# Altium project NanoD1.PrjPcb (part 1 of 2)
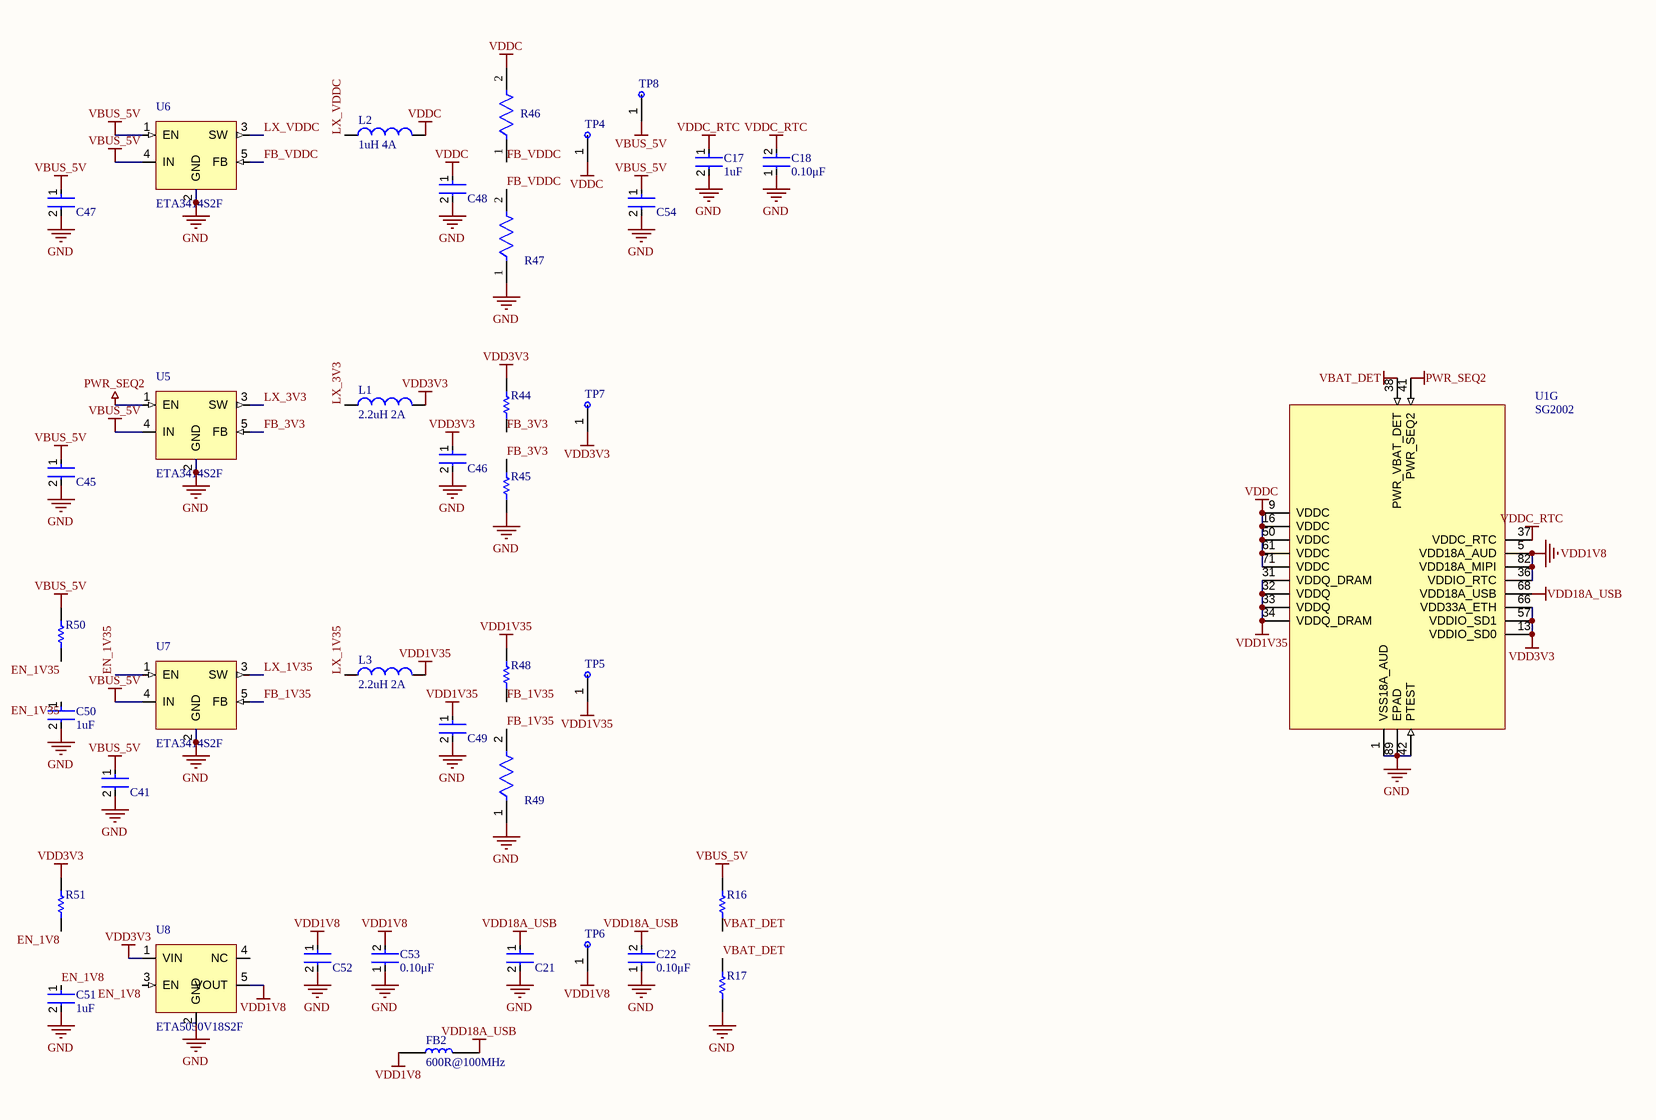
[diagram p0: NanoD1_Power.SchDoc]
8 sheets, 143 parts. Net scope: global (net labels, ports and power ports of the same name join across sheets).
Board file: NanoD1.PcbDoc
Sheets:
  NanoD1_Power.SchDoc
  NanoD1_Decoupling.SchDoc
  NanoD1_Storage.SchDoc
  NanoD1_USB.SchDoc
  NanoD1_Audio.SchDoc
  NanoD1_Wireless.SchDoc
  NanoD1_Clk_Reset.SchDoc
  NanoD1_IO.SchDoc

## Sheet NanoD1_Power.SchDoc
size 420 x 297 mm; ENG_APP_DATE: --/--/--; DSN_APP_DATE: --/--/--; CHK_APP_DATE: --/--/--; SheetNumber: 1; SheetTotal: 8

### Parts
C17  1uF  [FP-GRM15-0_1-IPC_B]
C18  value 0.10μF  [FP-GRM15-MFG]  (hidden comment: 100nF)
C21  10uF  [FP-GRM188-0_15-IPC_B]  (value not drawn)
C22  value 0.10μF  [FP-GRM15-MFG]  (hidden comment: 100nF)
C41  22uF  [FP-GRM21B-0_15-MFG]  (value not drawn)
C45  22uF  [FP-GRM21B-0_15-MFG]  (value not drawn)
C46  22uF  [FP-GRM188-0_2-IPC_C]  (value not drawn)
C47  22uF  [FP-GRM21B-0_15-MFG]  (value not drawn)
C48  22uF  [FP-GRM188-0_2-IPC_C]  (value not drawn)
C49  22uF  [FP-GRM188-0_2-IPC_C]  (value not drawn)
C50  1uF  [FP-GRM15-0_1-IPC_B]
C51  1uF  [FP-GRM15-0_1-IPC_B]
C52  4.7uF  [FP-GRM155-0_15-MFG]  (value not drawn)
C53  value 0.10μF  [FP-GRM15-MFG]  (hidden comment: 100nF)
C54  22uF  [FP-GRM21B-0_15-MFG]  (value not drawn)
FB2  600R@100MHz  [INDC1608X95N]
L1  2.2uH 2A  [FP-DFE252010C-MFG]
L2  value 1uH 4A  [FP-DFE252010C-MFG]  (hidden comment: 1.0uH 4A)
L3  2.2uH 2A  [FP-DFE252010C-MFG]
R16  30K 1%  [RESC1005X40X25ML05T10]  (value not drawn)
R17  10K 1%  [RESC1005X40X25ML05T10]  (value not drawn)
R44  100K 1%  [RESC1005X40X25ML05T10]  (value not drawn)
R45  22K6 1%  [RESC1005X40X25ML05T10]  (value not drawn)
R46  11K8 1%  [FP-RC0402-0_4-MFG]  (value not drawn)
R47  20K 1%  [FP-RC0402-0_4-MFG]  (value not drawn)
R48  15K 1%  [RESC1005X40X25ML05T10]  (value not drawn)
R49  12K 1%  [FP-RC0402-0_4-MFG]  (value not drawn)
R50  33K  [RESC1005X40X25ML05T10]  (value not drawn)
R51  33K  [RESC1005X40X25ML05T10]  (value not drawn)
TP4  TP  [TP-1.5mm]  (value not drawn)
TP5  TP  [TP-1.5mm]  (value not drawn)
TP6  TP  [TP-1.5mm]  (value not drawn)
TP7  TP  [TP-1.5mm]  (value not drawn)
TP8  TP  [TP-1.5mm]  (value not drawn)
U1  SG2002  [QFN88-9x9-0.35]  (part G of 7)
U5  ETA3414S2F  [SOT23-5]
U6  ETA3414S2F  [SOT23-5]
U7  ETA3414S2F  [SOT23-5]
U8  ETA5050V18S2F  [SOT23-5]

### Nets
GND: C17.2 C18.1 C21.2 C22.1 C41.2 C45.2 C46.2 C47.2 C48.2 C49.2 C50.2 C51.2 C52.2 C53.1 C54.2 R17.1 R45.1 R47.1 R49.1 U1.1(VSS18A_AUD) U1.42(PTEST) U1.89(EPAD) U5.2(GND) U6.2(GND) U7.2(GND) U8.2(GND)
PWR_SEQ2: U1.41(PWR_SEQ2) U5.1(EN)
VBAT_DET: R16.1 R17.2 U1.38(PWR_VBAT_DET)
VBUS_5V: C41.1 C45.1 C47.1 C54.1 R16.2 R50.2 TP8.1(TP) U5.4(IN) U6.1(EN) U6.4(IN) U7.4(IN)
VDD1V8: C52.1 C53.2 FB2.1 TP6.1(TP) U1.5(VDD18A_AUD) U1.36(VDDIO_RTC) U1.82(VDD18A_MIPI) U8.5(VOUT)
VDD1V35: C49.1 L3.2 R48.2 TP5.1(TP) U1.31(VDDQ_DRAM) U1.32(VDDQ) U1.33(VDDQ) U1.34(VDDQ_DRAM)
VDD3V3: C46.1 L1.2 R44.2 R51.2 TP7.1(TP) U1.13(VDDIO_SD0) U1.57(VDDIO_SD1) U1.66(VDD33A_ETH) U8.1(VIN)
VDD18A_USB: C21.1 C22.2 FB2.2 U1.68(VDD18A_USB)
VDDC: C48.1 L2.2 R46.2 TP4.1(TP) U1.9(VDDC) U1.16(VDDC) U1.50(VDDC) U1.61(VDDC) U1.71(VDDC)
VDDC_RTC: C17.1 C18.2 U1.37(VDDC_RTC)
EN_1V8: C51.1 R51.1 U8.3(EN)
EN_1V35: C50.1 R50.1 U7.1(EN)
FB_1V35: R48.1 R49.2 U7.5(FB)
FB_3V3: R44.1 R45.2 U5.5(FB)
FB_VDDC: R46.1 R47.2 U6.5(FB)
LX_1V35: L3.1 U7.3(SW)
LX_3V3: L1.1 U5.3(SW)
LX_VDDC: L2.1 U6.3(SW)

Not connected (* = marked no-connect by the designer): U8 4(NC)

### Notes on the sheet
- THIS DOCUMENT AND THE DATA DISCLOSED HEREIN OR
- HEREWITH IS THE PROPERTY OF ALTIUM LIMITED AND MAY
- DWG NO:
- REVISION
- REV:
- DESCRIPTION
- DATE
- APPROVED
- BE FREELY DISTRIBUTED IN WHOLE. NO RIGHTS ARE
- RESERVED OR EXPRESS OR IMPLIED WARANTEE GIVEN.
- ENG:
- APPROVALS
- PROJECT
- DSN:
- CHK:
- REFERENCE DOCUMENTS
- PROJECT REVISION:
- TITLE
- DOCUMENT REVISION:
- DESIGN ITEM:
- BOM:
- FAB DWG:
- PCB DWG:
- ASSY DWG:
- SCALE:
- A3
- SIZE
- CAGE CODE
- FILE NAME
- DWG NO.
- SHEET
- OF
- REV

### Library data of the parts
C17 C50 C51 = CMP-2008-04556-2: CAP CER 1UF 10V X5R 0402; Manufacturer Part Number: GRM155R61A105KE15D; Manufacturer: Murata; Material: Ceramic; Tolerance: 10%; Temperature Coefficient: 15%; Value: 1uF; Octopart: https://octopart.com/grm155r61a105ke15d-murata-197442; Lead Free: Yes; ComponentLink2Description: Datasheet; Temperature: -55°C to +85°C; Temperature Range High: +85°C; Height: 0.55mm; Capacitance: 1uF; Ipc Land Pattern Name: CAPC10050X50; ComponentLink2URL: https://search.murata.co.jp/Ceramy/image/img/A01X/G101/ENG/GRM155R61A105KE15-01A.pdf; Temperature Range Low: -55°C; Device Class L2: Capacitors; Voltage Rating: 10V; RoHS: TRUE; Device Class L1: Passive Components; Device Class L3: Ceramic Capacitors; Temperature Characteristic: X5R; Mouser Description: 0402 1 uF 10 V ±10% Tolerance X5R Surface Mount Multilayer Ceramic Capacitor; Automotive: No; Package: GRM15-0.1; Digikey Description: CAP CER 1UF 10V X5R 0402; Category: Cap
C18 C22 C53 = CMP-2100-03641-2: CAP CER 0.1UF 16V X7R 0402; Manufacturer Part Number: GRM155R71C104KA88D; Manufacturer: Murata; Standoff Height: 0mm; Tolerance: 10%; Voltage Rating: 16Vdc; Material: Ceramic; RoHS: TRUE; Temperature Characteristic: X7R; Octopart: https://octopart.com/grm155r71c104ka88d-murata-196880; Digikey Description: CAP CER 0.1UF 16V X7R 0402; Device Class L3: Ceramic Capacitors; Height: 0.55mm; ComponentLink2Description: Datasheet; Temperature Range Low: -55°C; Ipc Land Pattern Name: CAPC10050X219; ComponentLink2URL: https://search.murata.co.jp/Ceramy/image/img/A01X/G101/ENG/GRM155R71H471KA01-01A.pdf; Device Class L1: Passive Components; Lead Free: yes; Category: Cap; Package: GRM15; Temperature: -55°C to +125°C; Device Class L2: Capacitors; Capacitance: 0.10μF; Temperature Range High: +125°C; Mouser Description: 0402 0.1 uF 16V ±10 % Tolerance X7R SMT Multilayer Ceramic Capacitor
C21 = CMP-06035-003612-1: Chip Multilayer Ceramic Capacitors for General Purpose, 0603, 10uF, X5R, 15%, 20%, 10V; Tolerance: 20%; Dielectric: X5R; Package Quantity: 4000; Width: 0.8mm; Case/Package: 0603; Thickness: 0.035inch; Capacitance: 10uF; Voltage Rating: 10V; Voltage Rating (DC): 10V; Termination: SMD/SMT; Length: 1.6mm; Lead Free: Lead Free; Mount: Surface Mount; Height: 0.8mm; Depth: 0.8mm; Packaging: Tape and Reel; Weight: 0.000222oz; Min Operating Temperature: -55°C; Case Code (Metric): 1608; Max Operating Temperature: 85°C; Case Code (Imperial): 0603; Material: Ceramic
C41 C45 C47 C54 = CMP-2000-06340-2: Chip Multilayer Ceramic Capacitors for General Purpose, 0805, 22uF, X5R, 15%, 20%, 10V; Thickness: 0.055inch; Length: 2mm; Tolerance: 20%; Max Operating Temperature: 85°C; REACH SVHC: No SVHC; Capacitance: 22uF; Voltage Rating: 10V; Weight: 0.000335oz; Case Code (Metric): 2012; Case Code (Imperial): 0805; Height: 1.25mm; Min Operating Temperature: -55°C; Voltage Rating (DC): 10V; Lead Free: Lead Free; Package Quantity: 3000; Case/Package: 0805; Dielectric: X5R; Mount: Surface Mount; Termination: SMD/SMT; Width: 0.049inch; Depth: 1.25mm; Packaging: Tape and Reel; Radiation Hardening: No
C46 C48 C49 = CMP-2000-06337-3: Chip Multilayer Ceramic Capacitors for General Purpose, 0603, 22uF, X5R, 15%, 20%, 10V; Thickness: 0.039inch; Length: 1.6mm; Tolerance: 20%; Max Operating Temperature: 85°C; REACH SVHC: No SVHC; Capacitance: 22uF; Voltage Rating: 10V; Weight: 0.000222oz; Case Code (Metric): 1608; Case Code (Imperial): 0603; Height: 0.8mm; Min Operating Temperature: -55°C; Voltage Rating (DC): 10V; Lead Free: Lead Free; Package Quantity: 4000; Case/Package: 0603; Dielectric: X5R; Mount: Surface Mount; Termination: SMD/SMT; Width: 0.8mm; Depth: 0.8mm; Packaging: Tape and Reel; Material: Ceramic
C52 = CMP-06035-003573-1: Chip Multilayer Ceramic Capacitors for General Purpose, 0402, 4.7uF, X5R, 15%, 20%, 10V; Case/Package: 0402; Voltage Rating: 10V; Min Operating Temperature: -55°C; Mount: Surface Mount; Packaging: Tape and Reel; Max Operating Temperature: 85°C; Capacitance: 4.7uF; Case Code (Metric): 1005; Case Code (Imperial): 0402; Tolerance: 20%
FB2 = MPZ1608S601ATA00: 600 Ohms @ 100 MHz 1 Power Line Ferrite Bead 0603 (1608 Metric) 1A 150mOhm; MF: TDK; SnapEDA_Link: https://www.snapeda.com/parts/MPZ1608S601ATA00/TDK/view-part/?ref=snap; Package: 0603 TDK; Value: 600R@100MHz; MP: MPZ1608S601ATA00; Check_prices: https://www.snapeda.com/parts/MPZ1608S601ATA00/TDK/view-part/?ref=eda
L1-L3 = Inductor: Code_IEC: 1005; Published: 8-Jun-2000; LatestRevisionDate: 29-May-2009; LatestRevisionNote: IPC-7351 Footprint Added.; PackageReference: 0402-A; Publisher: Altium Limited; PackageDescription: Chip Inductor; Code_JEITA: 0402
  L1 L3: Value: 2.2uH 2A
R16 = CMP-2002-07602-1: Manufacturer: Yageo / Phycomp; Part Number: RC0402FR-0730KL
R17 = CMP-2002-07353-1: Part Number: RC0402FR-0710KL; Manufacturer: Yageo / Phycomp
R44 = CMP-2002-07343-1: Part Number: RC0402FR-07100KL; Manufacturer: Yageo / Phycomp
R45 = CMP-2002-07516-1: Part Number: RC0402FR-0722K6L; Manufacturer: Yageo
R46 = CMP-2002-07909-2: NexarPartId: 9293467; Resistance: 11.8kΩ; Voltage Rating (DC): 50V; Temperature Coefficient: 100ppm/°C; Max Power Dissipation: 63mW; Depth: 500µm; Features: Moisture Resistant; Tolerance: 1%; Case Code (Metric): 1005; Number of Terminations: 2; Width: 508µm; Length: 1mm; Case Code (Imperial): 0402; Max Operating Temperature: 155°C; Composition: Thick Film; Case/Package: 0402; Contact Plating: Lead, Tin; Weight: 652.039032µg; Voltage Rating: 50V; Military Standard: Not; Radiation Hardening: No; Termination: SMD/SMT; RoHS: Compliant; Height: 400µm; Lead Free: Lead Free; Packaging: Tape & Reel; Min Operating Temperature: -55°C; Schedule B: 8533210045, 8533210045|8533210045, 8533210045|8533210045|8533210045, 8533210045|8533210045|8533210045|8533210045; Power Rating: 63mW
R47 = CMP-2002-07501-2: NexarPartId: 39794396; Resistance: 20kΩ; Max Power Dissipation: 63mW; Voltage Rating: 50V; Temperature Coefficient: 100ppm/°C; Power Rating: 62.5mW; Termination: SMD/SMT; Features: Moisture Resistant; Max Operating Temperature: 155°C; Number of Pins: 2; Length: 1mm; Min Operating Temperature: -55°C; RoHS: Compliant; Width: 500µm; Composition: Thick Film; Case/Package: 0402; Depth: 500µm; Lead Free: Lead Free; Height: 350µm; Packaging: Tape & Reel; Military Standard: Not; Tolerance: 1%; Case Code (Imperial): 0402; Case Code (Metric): 1005; Schedule B: 8533210045, 8533210045|8533210045|8533210045|8533210045|8533210045|8533210045|8533210045|8533210045|8533210045|8533210045|8533210045|8533210045|8533210045|8533210045|8533210045|8533210045|8533210045|8533210045|8533210045|8533210045|8533210045|8533210045|8533210045|85; Number of Terminations: 2; Voltage Rating (DC): 50V; REACH SVHC: No SVHC
R48 = CMP-2002-07410-1: Manufacturer: Yageo / Phycomp; Part Number: RC0402FR0715KL
R49 = CMP-2002-07378-2: RES SMD 12K OHM 1% 1/16W 0402; Power Rating: 62.5mW; Voltage Rating: 50V; Resistance: 12kR; Max Power Dissipation: 63mW; Temperature Coefficient: 100ppm/°C; Construction: Rectangular; Case Code (Metric): 1005; Package Quantity: 1; Weight: 2.3E-05oz; RoHS Compliant: Yes; Packaging: Tape and Reel; Case Code (Imperial): 0402; Military Standard: Not; Min Operating Temperature: -55°C; Depth: 0.5mm; Length: 1mm; Width: 0.02inch; Termination: SMD/SMT; Lead Free: Lead Free; Tolerance: 1%; REACH SVHC: No SVHC; Size Code: 0402; Resistance Tolerance: 1%; Series: RC; Max Operating Temperature: 155°C; Height: 0.016inch; Features: Moisture Resistant; Number of Terminations: 2; Case/Package: 0402; Resistor Type: Thick Film
R50 R51 = CMP-2002-07617-1: Part Number: RC0402FR-0733KL; Manufacturer: Yageo / Phycomp
TP4-TP8 = TestPoint: Test point, 1.5 mm exposed pad
U1 = SG2002: RISC-V C906 / Cortex-A53 SoC, 256MB DDR3 SiP, QFN88 9x9 0.35mm
U5-U7 = ETA3414: 1.5A 3MHz synchronous step-down converter, SOT23-5
U8 = ETA5050V18: 1.8V fixed LDO, SOT23-5

## Sheet NanoD1_Decoupling.SchDoc
size 420 x 297 mm; SheetNumber: 2; SheetTotal: 8
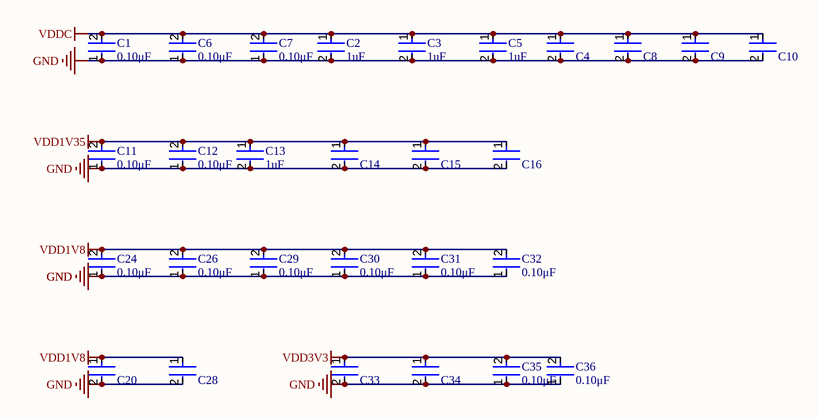
[diagram p1: NanoD1_Decoupling.SchDoc]

### Parts
C1  value 0.10μF  [FP-GRM15-MFG]  (hidden comment: 100nF)
C2  1uF  [FP-GRM15-0_1-IPC_B]
C3  1uF  [FP-GRM15-0_1-IPC_B]
C4  4.7uF  [FP-GRM155-0_15-MFG]  (value not drawn)
C5  1uF  [FP-GRM15-0_1-IPC_B]
C6  value 0.10μF  [FP-GRM15-MFG]  (hidden comment: 100nF)
C7  value 0.10μF  [FP-GRM15-MFG]  (hidden comment: 100nF)
C8  4.7uF  [FP-GRM155-0_15-MFG]  (value not drawn)
C9  10uF  [FP-GRM188-0_15-IPC_B]  (value not drawn)
C10  10uF  [FP-GRM188-0_15-IPC_B]  (value not drawn)
C11  value 0.10μF  [FP-GRM15-MFG]  (hidden comment: 100nF)
C12  value 0.10μF  [FP-GRM15-MFG]  (hidden comment: 100nF)
C13  1uF  [FP-GRM15-0_1-IPC_B]
C14  4.7uF  [FP-GRM155-0_15-MFG]  (value not drawn)
C15  4.7uF  [FP-GRM155-0_15-MFG]  (value not drawn)
C16  10uF  [FP-GRM188-0_15-IPC_B]  (value not drawn)
C20  10uF  [FP-GRM188-0_15-IPC_B]  (value not drawn)
C24  value 0.10μF  [FP-GRM15-MFG]  (hidden comment: 100nF)
C26  value 0.10μF  [FP-GRM15-MFG]  (hidden comment: 100nF)
C28  10uF  [FP-GRM188-0_15-IPC_B]  (value not drawn)
C29  value 0.10μF  [FP-GRM15-MFG]  (hidden comment: 100nF)
C30  value 0.10μF  [FP-GRM15-MFG]  (hidden comment: 100nF)
C31  value 0.10μF  [FP-GRM15-MFG]  (hidden comment: 100nF)
C32  value 0.10μF  [FP-GRM15-MFG]  (hidden comment: 100nF)
C33  10uF  [FP-GRM188-0_15-IPC_B]  (value not drawn)
C34  10uF  [FP-GRM188-0_15-IPC_B]  (value not drawn)
C35  value 0.10μF  [FP-GRM15-MFG]  (hidden comment: 100nF)
C36  value 0.10μF  [FP-GRM15-MFG]  (hidden comment: 100nF)

### Nets
GND: C1.1 C2.2 C3.2 C4.2 C5.2 C6.1 C7.1 C8.2 C9.2 C10.2 C11.1 C12.1 C13.2 C14.2 C15.2 C16.2 C20.2 C24.1 C26.1 C28.2 C29.1 C30.1 C31.1 C32.1 C33.2 C34.2 C35.1 C36.1
VDD1V8: C20.1 C24.2 C26.2 C28.1 C29.2 C30.2 C31.2 C32.2
VDD1V35: C11.2 C12.2 C13.1 C14.1 C15.1 C16.1
VDD3V3: C33.1 C34.1 C35.2 C36.2
VDDC: C1.2 C2.1 C3.1 C4.1 C5.1 C6.2 C7.2 C8.1 C9.1 C10.1

### Notes on the sheet
- THIS DOCUMENT AND THE DATA DISCLOSED HEREIN OR
- HEREWITH IS THE PROPERTY OF ALTIUM LIMITED AND MAY
- DWG NO:
- REVISION
- REV:
- DESCRIPTION
- DATE
- APPROVED
- BE FREELY DISTRIBUTED IN WHOLE. NO RIGHTS ARE
- RESERVED OR EXPRESS OR IMPLIED WARANTEE GIVEN.
- ENG:
- APPROVALS
- PROJECT
- DSN:
- CHK:
- REFERENCE DOCUMENTS
- PROJECT REVISION:
- TITLE
- DOCUMENT REVISION:
- DESIGN ITEM:
- BOM:
- FAB DWG:
- PCB DWG:
- ASSY DWG:
- SCALE:
- A3
- SIZE
- CAGE CODE
- FILE NAME
- DWG NO.
- SHEET
- OF
- REV

### Library data of the parts
C1 C6 C7 C11 C12 C24 C26 C29-C32 C35 C36 = CMP-2100-03641-2: as C18 on sheet NanoD1_Power; RoHS: TRUE; Temperature Characteristic: X7R; Octopart: https://octopart.com/grm155r71c104ka88d-murata-196880; Digikey Description: CAP CER 0.1UF 16V X7R 0402; Device Class L3: Ceramic Capacitors; Height: 0.55mm; ComponentLink2Description: Datasheet; Temperature Range Low: -55°C; Ipc Land Pattern Name: CAPC10050X219; ComponentLink2URL: https://search.murata.co.jp/Ceramy/image/img/A01X/G101/ENG/GRM155R71H471KA01-01A.pdf; Device Class L1: Passive Components; Lead Free: yes; Category: Cap; Package: GRM15; Temperature: -55°C to +125°C; Device Class L2: Capacitors; Capacitance: 0.10μF; Temperature Range High: +125°C; Mouser Description: 0402 0.1 uF 16V ±10 % Tolerance X7R SMT Multilayer Ceramic Capacitor
C2 C3 C5 C13 = CMP-2008-04556-2: as C17 on sheet NanoD1_Power; Value: 1uF; Octopart: https://octopart.com/grm155r61a105ke15d-murata-197442; Lead Free: Yes; ComponentLink2Description: Datasheet; Temperature: -55°C to +85°C; Temperature Range High: +85°C; Height: 0.55mm; Capacitance: 1uF; Ipc Land Pattern Name: CAPC10050X50; ComponentLink2URL: https://search.murata.co.jp/Ceramy/image/img/A01X/G101/ENG/GRM155R61A105KE15-01A.pdf; Temperature Range Low: -55°C; Device Class L2: Capacitors; Voltage Rating: 10V; RoHS: TRUE; Device Class L1: Passive Components; Device Class L3: Ceramic Capacitors; Temperature Characteristic: X5R; Mouser Description: 0402 1 uF 10 V ±10% Tolerance X5R Surface Mount Multilayer Ceramic Capacitor; Automotive: No; Package: GRM15-0.1; Digikey Description: CAP CER 1UF 10V X5R 0402; Category: Cap
C4 C8 C14 C15 = CMP-06035-003573-1: as C52 on sheet NanoD1_Power; Case/Package: 0402; Voltage Rating: 10V; Min Operating Temperature: -55°C; Mount: Surface Mount; Packaging: Tape and Reel; Max Operating Temperature: 85°C; Capacitance: 4.7uF; Case Code (Metric): 1005; Case Code (Imperial): 0402; Tolerance: 20%
C9 C10 C16 C20 C28 C33 C34 = CMP-06035-003612-1: as C21 on sheet NanoD1_Power; Tolerance: 20%; Dielectric: X5R; Package Quantity: 4000; Width: 0.8mm; Case/Package: 0603; Thickness: 0.035inch; Capacitance: 10uF; Voltage Rating: 10V; Voltage Rating (DC): 10V; Termination: SMD/SMT; Length: 1.6mm; Lead Free: Lead Free; Mount: Surface Mount; Height: 0.8mm; Depth: 0.8mm; Packaging: Tape and Reel; Weight: 0.000222oz; Min Operating Temperature: -55°C; Case Code (Metric): 1608; Max Operating Temperature: 85°C; Case Code (Imperial): 0603; Material: Ceramic

## Sheet NanoD1_Storage.SchDoc
size 420 x 297 mm; SheetNumber: 3; SheetTotal: 8
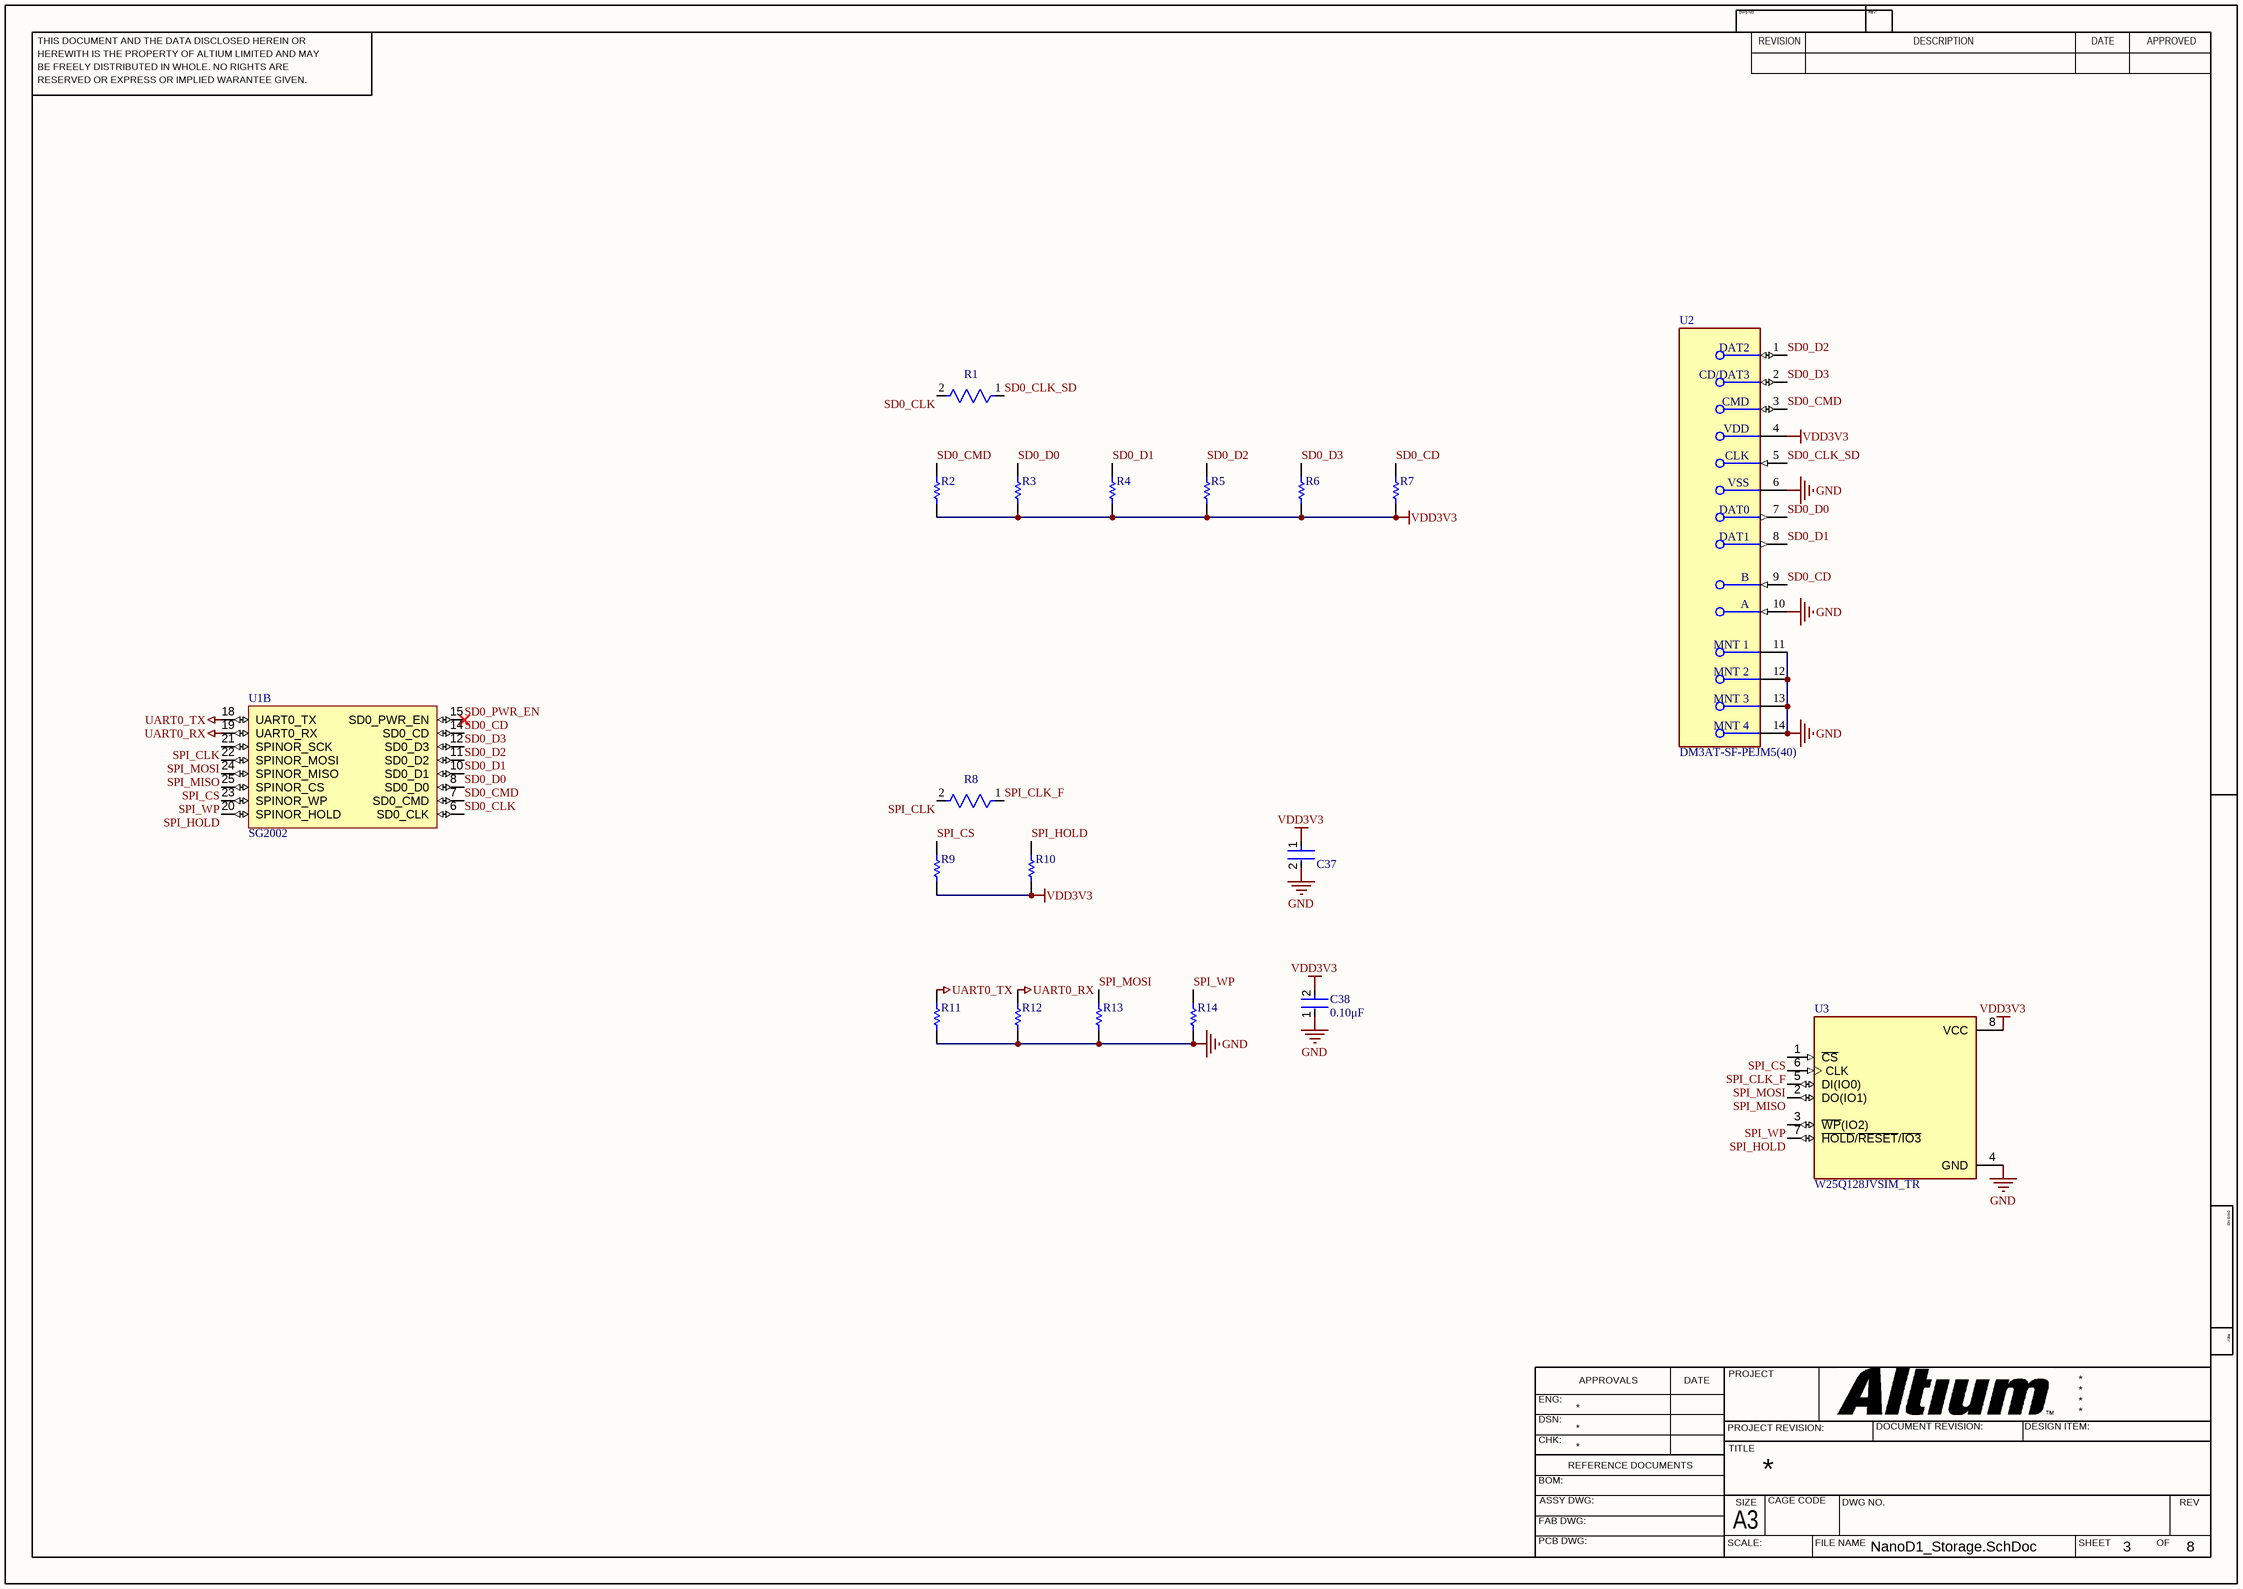
[diagram p2: NanoD1_Storage.SchDoc]

### Parts
C37  10uF  [FP-GRM188-0_15-IPC_B]  (value not drawn)
C38  value 0.10μF  [FP-GRM15-MFG]  (hidden comment: 100nF)
R1  22R  [FP-RC0402-0_4-IPC_A]  (value not drawn)
R2  10K  [RESC1005X40X25ML05T10]  (value not drawn)
R3  10K  [RESC1005X40X25ML05T10]  (value not drawn)
R4  10K  [RESC1005X40X25ML05T10]  (value not drawn)
R5  10K  [RESC1005X40X25ML05T10]  (value not drawn)
R6  10K  [RESC1005X40X25ML05T10]  (value not drawn)
R7  10K 1%  [RESC1005X40X25ML05T10]  (value not drawn)
R8  22R  [FP-RC0402-0_4-IPC_A]  (value not drawn)
R9  4.7K  [RESC1005X40X25ML05T10]  (value not drawn)
R10  4.7K  [RESC1005X40X25ML05T10]  (value not drawn)
R11  4.7K  [RESC1005X40X25ML05T10]  (value not drawn)
R12  4.7K  [RESC1005X40X25ML05T10]  (value not drawn)
R13  4.7K  [RESC1005X40X25ML05T10]  (value not drawn)
R14  4.7K  [RESC1005X40X25ML05T10]  (value not drawn)
U1  SG2002  [QFN88-9x9-0.35]  (part B of 7)
U2  DM3AT-SF-PEJM5(40)  [FP-DM3AT-SF-PEJM5_40-MFG]
U3  W25Q128JVSIM_TR  [SOIC127P790X216-8N]

### Nets
GND: C37.2 C38.1 R11.1 R12.1 R13.1 R14.1 U2.6(VSS) U2.10(A) U2.11(MNT_1) U2.12(MNT_2) U2.13(MNT_3) U2.14(MNT_4) U3.4(GND)
UART0_RX: R12.2 U1.19(UART0_RX)
UART0_TX: R11.2 U1.18(UART0_TX)
VDD3V3: C37.1 C38.2 R2.1 R3.1 R4.1 R5.1 R6.1 R7.1 R9.1 R10.1 U2.4(VDD) U3.8(VCC)
SD0_CD: R7.2 U1.14(SD0_CD) U2.9(B)
SD0_CLK: R1.2 U1.6(SD0_CLK)
SD0_CLK_SD: R1.1 U2.5(CLK)
SD0_CMD: R2.2 U1.7(SD0_CMD) U2.3(CMD)
SD0_D0: R3.2 U1.8(SD0_D0) U2.7(DAT0)
SD0_D1: R4.2 U1.10(SD0_D1) U2.8(DAT1)
SD0_D2: R5.2 U1.11(SD0_D2) U2.1(DAT2)
SD0_D3: R6.2 U1.12(SD0_D3) U2.2(CD/DAT3)
SD0_PWR_EN: U1.15(SD0_PWR_EN)
SPI_CLK: R8.2 U1.21(SPINOR_SCK)
SPI_CLK_F: R8.1 U3.6(CLK)
SPI_CS: R9.2 U1.25(SPINOR_CS) U3.1(~{CS})
SPI_HOLD: R10.2 U1.20(SPINOR_HOLD) U3.7(~{HOLD}/~{RESET}/~{IO3})
SPI_MISO: U1.24(SPINOR_MISO) U3.2(DO(IO1))
SPI_MOSI: R13.2 U1.22(SPINOR_MOSI) U3.5(DI(IO0))
SPI_WP: R14.2 U1.23(SPINOR_WP) U3.3(~{WP}(IO2))

### Notes on the sheet
- THIS DOCUMENT AND THE DATA DISCLOSED HEREIN OR
- HEREWITH IS THE PROPERTY OF ALTIUM LIMITED AND MAY
- DWG NO:
- REVISION
- REV:
- DESCRIPTION
- DATE
- APPROVED
- BE FREELY DISTRIBUTED IN WHOLE. NO RIGHTS ARE
- RESERVED OR EXPRESS OR IMPLIED WARANTEE GIVEN.
- ENG:
- APPROVALS
- PROJECT
- DSN:
- CHK:
- REFERENCE DOCUMENTS
- PROJECT REVISION:
- TITLE
- DOCUMENT REVISION:
- DESIGN ITEM:
- BOM:
- FAB DWG:
- PCB DWG:
- ASSY DWG:
- SCALE:
- A3
- SIZE
- CAGE CODE
- FILE NAME
- DWG NO.
- SHEET
- OF
- REV

### Library data of the parts
C37 = CMP-06035-003612-1: as C21 on sheet NanoD1_Power; Tolerance: 20%; Dielectric: X5R; Package Quantity: 4000; Width: 0.8mm; Case/Package: 0603; Thickness: 0.035inch; Capacitance: 10uF; Voltage Rating: 10V; Voltage Rating (DC): 10V; Termination: SMD/SMT; Length: 1.6mm; Lead Free: Lead Free; Mount: Surface Mount; Height: 0.8mm; Depth: 0.8mm; Packaging: Tape and Reel; Weight: 0.000222oz; Min Operating Temperature: -55°C; Case Code (Metric): 1608; Max Operating Temperature: 85°C; Case Code (Imperial): 0603; Material: Ceramic
C38 = CMP-2100-03641-2: as C18 on sheet NanoD1_Power; RoHS: TRUE; Temperature Characteristic: X7R; Octopart: https://octopart.com/grm155r71c104ka88d-murata-196880; Digikey Description: CAP CER 0.1UF 16V X7R 0402; Device Class L3: Ceramic Capacitors; Height: 0.55mm; ComponentLink2Description: Datasheet; Temperature Range Low: -55°C; Ipc Land Pattern Name: CAPC10050X219; ComponentLink2URL: https://search.murata.co.jp/Ceramy/image/img/A01X/G101/ENG/GRM155R71H471KA01-01A.pdf; Device Class L1: Passive Components; Lead Free: yes; Category: Cap; Package: GRM15; Temperature: -55°C to +125°C; Device Class L2: Capacitors; Capacitance: 0.10μF; Temperature Range High: +125°C; Mouser Description: 0402 0.1 uF 16V ±10 % Tolerance X7R SMT Multilayer Ceramic Capacitor
R1 R8 = CMP-2002-07520-2: Tolerance: 1%; Power Rating: 63mW; Voltage Rating: 50V; Temperature Coefficient: 100ppm/°C; Resistance: 22Ω; Termination: SMD/SMT; Depth: 500µm; Packaging: Tape & Reel; Height: 400µm; Width: 500µm; Case Code (Imperial): 0402; Length: 1mm; Schedule B: 8533210045, 8533210045|8533210045|8533210045|8533210045|8533210045|8533210045|8533210045|8533210045, 8533210045|8533210045|8533210045|8533210045|8533210045|8533210045|8533210045|8533210045|8533210045, 8533210045|8533210045|8533210045|8533210045|8533210045|8533210045|8533210045|8533210045|8533210045|8533210045; Case/Package: 0402; Max Operating Temperature: 155°C; Min Operating Temperature: -55°C; REACH SVHC: Unknown; RoHS: Compliant; Military Standard: Not; Voltage Rating (DC): 50V; Lead Free: Lead Free; Voltage Rating (AC): 50V; Number of Pins: 2; Composition: Thick Film
R2-R7 = CMP-2002-07353-1: as R17 on sheet NanoD1_Power
R9-R14 = CMP-1011-00586-2: Manufacturer: Yageo / Phycomp; Part Number: RC0402FR-074K7L
U1 = SG2002: as U1 on sheet NanoD1_Power
U2 = CMP-11597-000006-1: CONN MICRO SD R/A PUSH-PUSH SMD; Contact Resistance: 100mR; Insulation Resistance: 1GR; Gender: Receptacle; Max Voltage Rating (AC): 125V; Pitch: 1.1mm; Mating Cycles: 10000; Max Current Rating: 500mA; Connector Type: Connector; Number of Contacts: 8; Housing Material: Polymer; Flammability Rating: UL94 V-0; REACH SVHC: No SVHC; Lead Free: Lead Free; Package Quantity: 400; Length: 13.85mm; Number of Rows: 2; Series: DM3; Min Operating Temperature: -25°C; Voltage Rating (AC): 125V; Contact Material: Copper Alloy; Depth: 15.95mm; Contact Plating: Gold; Packaging: Tape and Reel; Width: 13.85mm; Orientation: Right Angle; Color: Black; Voltage Rating: 125V; Radiation Hardening: No; Termination: Solder; Current Rating: 500mA; Mount: Surface Mount; Max Operating Temperature: 85°C
U3 = W25Q128JVSIM_TR: FLASH - NOR Memory IC 128Mb (16M x 8) SPI - Quad I/O, QPI, DTR 133 MHz 8-SOIC; MF: Winbond Electronics; MP: W25Q128JVSIM TR; SnapEDA_Link: https://www.snapeda.com/parts/W25Q128JVSIM%20TR/Winbond/view-part/?ref=snap; Package: SOIC-8 Winbond Electronics; Value: *; Check_prices: https://www.snapeda.com/parts/W25Q128JVSIM%20TR/Winbond/view-part/?ref=eda

## Sheet NanoD1_USB.SchDoc
size 420 x 297 mm; SheetNumber: 4; SheetTotal: 8
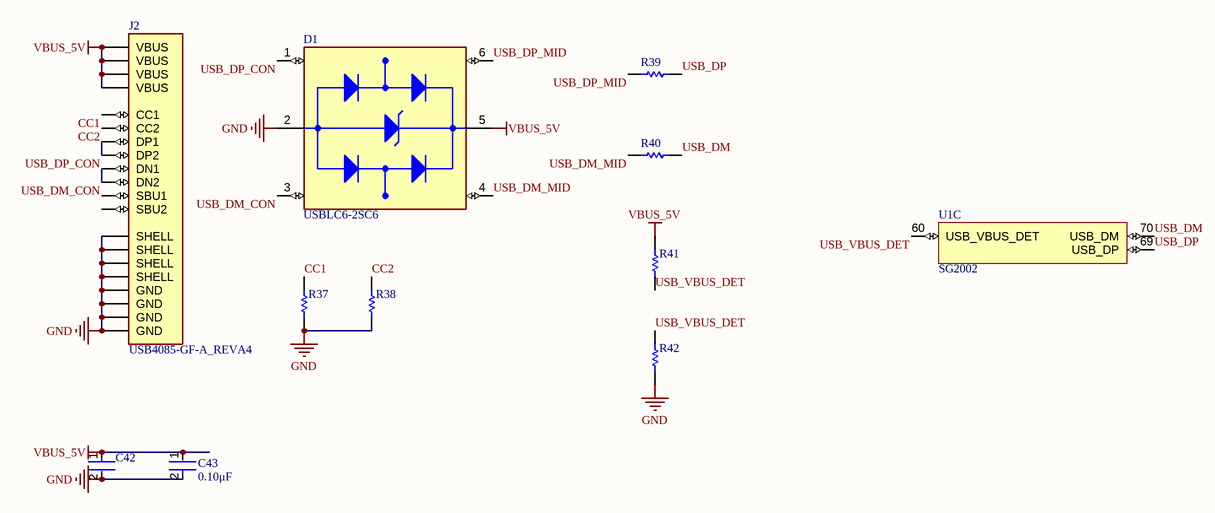
[diagram p3: NanoD1_USB.SchDoc]

### Parts
C42  10uF  [FP-GRM188-0_15-IPC_B]  (value not drawn)
C43  value 0.10μF  [FP-GRM15-MFG]  (hidden comment: 100nF)
D1  USBLC6-2SC6  [SOT95P280X145-6N]
J2  USB4085-GF-A_REVA4  [GCT_USB4085-GF-A_REVA4]
R37  5K1  [RESC1005X40X25ML05T10]  (value not drawn)
R38  5K1  [RESC1005X40X25ML05T10]  (value not drawn)
R39  5R1  [RESC1005X40X25ML05T10]  (value not drawn)
R40  5R1  [RESC1005X40X25ML05T10]  (value not drawn)
R41  100K  [RESC1005X40X25ML05T10]  (value not drawn)
R42  47K  [RESC1005X40X25ML05T10]  (value not drawn)
U1  SG2002  [QFN88-9x9-0.35]  (part C of 7)

### Nets
GND: C42.2 C43.2 D1.2(GND) J2.A1(GND) J2.A12(GND) J2.B1(GND) J2.B12(GND) J2.S1(SHELL) J2.S2(SHELL) J2.S3(SHELL) J2.S4(SHELL) R37.1 R38.1 R42.1
VBUS_5V: C42.1 C43.1 D1.5(VBUS) J2.A4(VBUS) J2.A9(VBUS) J2.B4(VBUS) J2.B9(VBUS) R41.2
CC1: J2.A5(CC1) R37.2
CC2: J2.B5(CC2) R38.2
USB_DM: R40.1 U1.70(USB_DM)
USB_DM_CON: D1.3(I/O2_IN) J2.A7(DN1) J2.B7(DN2)
USB_DM_MID: D1.4(I/O2_OUT) R40.2
USB_DP: R39.1 U1.69(USB_DP)
USB_DP_CON: D1.1(I/O1_IN) J2.A6(DP1) J2.B6(DP2)
USB_DP_MID: D1.6(I/O1_OUT) R39.2
USB_VBUS_DET: R41.1 R42.2 U1.60(USB_VBUS_DET)

Not connected (* = marked no-connect by the designer): J2 A8(SBU1) B8(SBU2)

### Notes on the sheet
- THIS DOCUMENT AND THE DATA DISCLOSED HEREIN OR
- HEREWITH IS THE PROPERTY OF ALTIUM LIMITED AND MAY
- DWG NO:
- REVISION
- REV:
- DESCRIPTION
- DATE
- APPROVED
- BE FREELY DISTRIBUTED IN WHOLE. NO RIGHTS ARE
- RESERVED OR EXPRESS OR IMPLIED WARANTEE GIVEN.
- ENG:
- APPROVALS
- PROJECT
- DSN:
- CHK:
- REFERENCE DOCUMENTS
- PROJECT REVISION:
- TITLE
- DOCUMENT REVISION:
- DESIGN ITEM:
- BOM:
- FAB DWG:
- PCB DWG:
- ASSY DWG:
- SCALE:
- A3
- SIZE
- CAGE CODE
- FILE NAME
- DWG NO.
- SHEET
- OF
- REV

### Library data of the parts
C42 = CMP-06035-003612-1: as C21 on sheet NanoD1_Power; Tolerance: 20%; Dielectric: X5R; Package Quantity: 4000; Width: 0.8mm; Case/Package: 0603; Thickness: 0.035inch; Capacitance: 10uF; Voltage Rating: 10V; Voltage Rating (DC): 10V; Termination: SMD/SMT; Length: 1.6mm; Lead Free: Lead Free; Mount: Surface Mount; Height: 0.8mm; Depth: 0.8mm; Packaging: Tape and Reel; Weight: 0.000222oz; Min Operating Temperature: -55°C; Case Code (Metric): 1608; Max Operating Temperature: 85°C; Case Code (Imperial): 0603; Material: Ceramic
C43 = CMP-2100-03641-2: as C18 on sheet NanoD1_Power; RoHS: TRUE; Temperature Characteristic: X7R; Octopart: https://octopart.com/grm155r71c104ka88d-murata-196880; Digikey Description: CAP CER 0.1UF 16V X7R 0402; Device Class L3: Ceramic Capacitors; Height: 0.55mm; ComponentLink2Description: Datasheet; Temperature Range Low: -55°C; Ipc Land Pattern Name: CAPC10050X219; ComponentLink2URL: https://search.murata.co.jp/Ceramy/image/img/A01X/G101/ENG/GRM155R71H471KA01-01A.pdf; Device Class L1: Passive Components; Lead Free: yes; Category: Cap; Package: GRM15; Temperature: -55°C to +125°C; Device Class L2: Capacitors; Capacitance: 0.10μF; Temperature Range High: +125°C; Mouser Description: 0402 0.1 uF 16V ±10 % Tolerance X7R SMT Multilayer Ceramic Capacitor
D1 = USBLC6-2SC6: 17V Clamp 5A (8/20Âµs) Ipp Tvs Diode Surface Mount SOT-23-6; MF: STMicroelectronics; Value: *; SnapEDA_Link: https://www.snapeda.com/parts/USBLC6-2SC6/STMicroelectronics/view-part/?ref=snap; Check_prices: https://www.snapeda.com/parts/USBLC6-2SC6/STMicroelectronics/view-part/?ref=eda; Purchase-URL: https://pricing.snapeda.com/search/part/USBLC6-2SC6/?ref=eda; Price: None; Availability: In Stock; Package: SOT-23-6 STMicroelectronics; MP: USBLC6-2SC6
J2 = USB4085-GF-A_REVA4: USB-C (USB TYPE-C) USB 2.0 Receptacle Connector 24 (16+8 Dummy) Position Through Hole, Right Angle, low cost, 3.46mm profile, 16 pin, horizontal, Top mount; MF: Global Connector Technology; SnapEDA_Link: https://www.snapeda.com/parts/USB4085-GF-A/Global+Connector+Technology/view-part/?ref=snap; Package: None; MP: USB4085-GF-A; Check_prices: https://www.snapeda.com/parts/USB4085-GF-A/Global+Connector+Technology/view-part/?ref=eda; Purchase-URL: https://pricing.snapeda.com/search/part/USB4085-GF-A/?ref=eda; Price: None; Value: *; Availability: In Stock
R37 R38 = CMP-2002-07753-1: Part Number: RC0402FR-075K1L; Manufacturer: Yageo / Phycomp
R39 R40 = CMP-2002-07068-1: Part Number: RC0402FR-075R1L; Manufacturer: Yageo / Phycomp
R41 = CMP-2002-07343-1: as R44 on sheet NanoD1_Power
R42 = CMP-2002-07701-1: Part Number: RC0402FR-0747KL; Manufacturer: Yageo / Phycomp
U1 = SG2002: as U1 on sheet NanoD1_Power

## Sheet NanoD1_Audio.SchDoc
size 420 x 297 mm; SheetNumber: 5; SheetTotal: 8
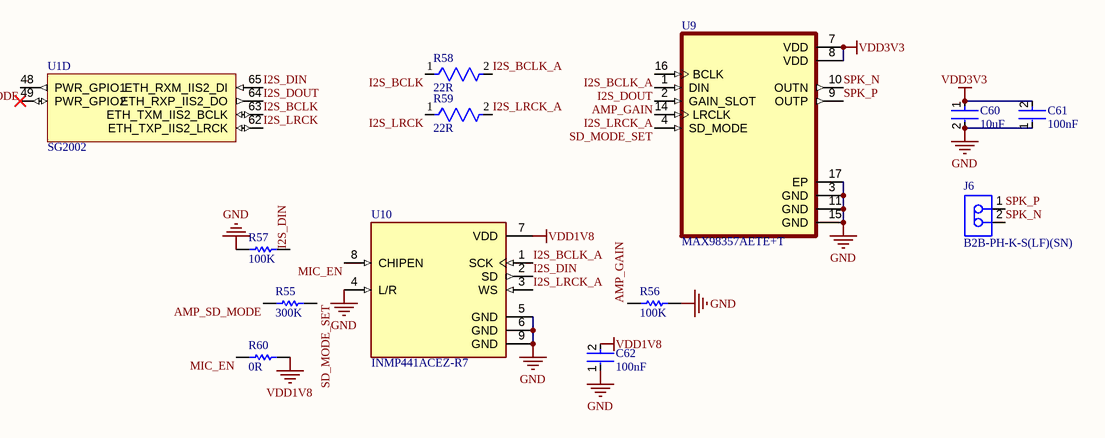
[diagram p4: NanoD1_Audio.SchDoc]

### Parts
C60  10uF  [FP-GRM188-0_15-IPC_B]
C61  100nF  [FP-GRM15-MFG]
C62  100nF  [FP-GRM15-MFG]
J6  B2B-PH-K-S(LF)(SN)  [JST-B2B-PH-K-S_V]
R55  300K  [RESC1005X40X25ML05T10]
R56  100K  [RESC1005X40X25ML05T10]
R57  100K  [RESC1005X40X25ML05T10]
R58  22R  [FP-RC0402-0_4-IPC_A]
R59  22R  [FP-RC0402-0_4-IPC_A]
R60  0R  [RESC1005X40X25ML05T10]
U1  SG2002  [QFN88-9x9-0.35]  (part D of 7)
U9  MAX98357AETE+T  [QFN50P300X300X80-17N]
U10  INMP441ACEZ-R7  [MIC_INMP441ACEZ-R7]

### Nets
GND: C60.2 C61.1 C62.1 R56.2 R57.1 U9.3(GND) U9.11(GND) U9.15(GND) U9.17(EP) U10.4(L/R) U10.5(GND) U10.6(GND) U10.9(GND)
VDD1V8: C62.2 R60.2 U10.7(VDD)
VDD3V3: C60.1 C61.2 U9.7(VDD) U9.8(VDD)
AMP_GAIN: R56.1 U9.2(GAIN_SLOT)
AMP_SD_MODE: R55.1 U1.48(PWR_GPIO1)
I2S_BCLK: R58.1 U1.63(ETH_TXM_IIS2_BCLK)
I2S_BCLK_A: R58.2 U9.16(BCLK) U10.1(SCK)
I2S_DIN: R57.2 U1.65(ETH_RXM_IIS2_DI) U10.2(SD)
I2S_DOUT: U1.64(ETH_RXP_IIS2_DO) U9.1(DIN)
I2S_LRCK: R59.1 U1.62(ETH_TXP_IIS2_LRCK)
I2S_LRCK_A: R59.2 U9.14(LRCLK) U10.3(WS)
MIC_EN: R60.1 U10.8(CHIPEN)
SD_MODE_SET: R55.2 U9.4(SD_MODE)
SPK_N: J6.2 U9.10(OUTN)
SPK_P: J6.1 U9.9(OUTP)

Not connected (* = marked no-connect by the designer): U1 49(PWR_GPIO2)*

### Notes on the sheet
- THIS DOCUMENT AND THE DATA DISCLOSED HEREIN OR
- HEREWITH IS THE PROPERTY OF ALTIUM LIMITED AND MAY
- DWG NO:
- REVISION
- REV:
- DESCRIPTION
- DATE
- APPROVED
- BE FREELY DISTRIBUTED IN WHOLE. NO RIGHTS ARE
- RESERVED OR EXPRESS OR IMPLIED WARANTEE GIVEN.
- ENG:
- APPROVALS
- PROJECT
- DSN:
- CHK:
- REFERENCE DOCUMENTS
- PROJECT REVISION:
- TITLE
- DOCUMENT REVISION:
- DESIGN ITEM:
- BOM:
- FAB DWG:
- PCB DWG:
- ASSY DWG:
- SCALE:
- A3
- SIZE
- CAGE CODE
- FILE NAME
- DWG NO.
- SHEET
- OF
- REV

### Library data of the parts
C60 = CMP-06035-003612-1: as C21 on sheet NanoD1_Power; Tolerance: 20%; Dielectric: X5R; Package Quantity: 4000; Width: 0.8mm; Case/Package: 0603; Thickness: 0.035inch; Capacitance: 10uF; Voltage Rating: 10V; Voltage Rating (DC): 10V; Termination: SMD/SMT; Length: 1.6mm; Lead Free: Lead Free; Mount: Surface Mount; Height: 0.8mm; Depth: 0.8mm; Packaging: Tape and Reel; Weight: 0.000222oz; Min Operating Temperature: -55°C; Case Code (Metric): 1608; Max Operating Temperature: 85°C; Case Code (Imperial): 0603; Material: Ceramic
C61 C62 = CMP-2100-03641-2: CAP CER 0.1UF 16V X7R 0402; Manufacturer Part Number: GRM155R71C104KA88D; Manufacturer: Murata; Standoff Height: 0mm; Tolerance: 10%; Voltage Rating: 16Vdc; Material: Ceramic; Capacitance: 0.10μF; Value: 0.10μF; RoHS: TRUE; Temperature Characteristic: X7R; Octopart: https://octopart.com/grm155r71c104ka88d-murata-196880; Digikey Description: CAP CER 0.1UF 16V X7R 0402; Device Class L3: Ceramic Capacitors; Height: 0.55mm; ComponentLink2Description: Datasheet; Temperature Range Low: -55°C; Ipc Land Pattern Name: CAPC10050X219; ComponentLink2URL: https://search.murata.co.jp/Ceramy/image/img/A01X/G101/ENG/GRM155R71H471KA01-01A.pdf; Device Class L1: Passive Components; Lead Free: yes; Category: Cap; Package: GRM15; Temperature: -55°C to +125°C; Device Class L2: Capacitors; Temperature Range High: +125°C; Mouser Description: 0402 0.1 uF 16V ±10 % Tolerance X7R SMT Multilayer Ceramic Capacitor
J6 = CMP-2000-05162-1: Male Header, Pitch 2 mm, 1 x 2 Position, Height 6 mm, Tail Length 3.4 mm, -25 to 85 degC, RoHS, Bulk; Manufacturer: JST; Pitch: 2mm; Style/Orientation: StraightHeader/Plug; No of Positions: 2; Datasheet Version: Nov-08; Datasheet URL: http://datasheet.octopart.com/B2B-PH-K-S%28LF%29%28SN%29-JST-datasheet-8324864.pdf; Manufacturer URL: http://www.jst.com/home2.html; Type: ShroudedHeader; Termination: Crimp
R55 = CMP-2002-07008-1: Manufacturer: Yageo / Phycomp; Part Number: RC0402FR-07300KL
R56 R57 = CMP-2002-07343-1: as R44 on sheet NanoD1_Power
R58 R59 = CMP-2002-07520-2: as R1 on sheet NanoD1_Storage; Termination: SMD/SMT; Depth: 500µm; Packaging: Tape & Reel; Height: 400µm; Width: 500µm; Case Code (Imperial): 0402; Length: 1mm; Schedule B: 8533210045, 8533210045|8533210045|8533210045|8533210045|8533210045|8533210045|8533210045|8533210045, 8533210045|8533210045|8533210045|8533210045|8533210045|8533210045|8533210045|8533210045|8533210045, 8533210045|8533210045|8533210045|8533210045|8533210045|8533210045|8533210045|8533210045|8533210045|8533210045; Case/Package: 0402; Max Operating Temperature: 155°C; Min Operating Temperature: -55°C; REACH SVHC: Unknown; RoHS: Compliant; Military Standard: Not; Voltage Rating (DC): 50V; Lead Free: Lead Free; Voltage Rating (AC): 50V; Number of Pins: 2; Composition: Thick Film
R60 = CMP-1011-00001-2: Manufacturer: Yageo / Phycomp; Part Number: RC0402JR-070RL
U1 = SG2002: as U1 on sheet NanoD1_Power
U9 = MAX98357AETE+T: Tiny, Low-Cost, PCM Class D Amplifier with Class AB Performance; MF: Analog Devices; SnapEDA_Link: https://www.snapeda.com/parts/MAX98357AETE+T/Analog+Devices/view-part/?ref=snap; Package: TQFN-16 Maxim; Value: *; MP: MAX98357AETE+T; Check_prices: https://www.snapeda.com/parts/MAX98357AETE+T/Analog+Devices/view-part/?ref=eda
U10 = INMP441ACEZ-R7: 60 Hz ~ 15 kHz Digital, I2S Microphone MEMS (Silicon) 1.62 V ~ 3.63 V Omnidirectional (-26dB Â±3dB @ 94dB SPL) Solder Pads; MF: TDK InvenSense; SnapEDA_Link: https://www.snapeda.com/parts/INMP441ACEZ-R7/TDK/view-part/?ref=snap; Package: LGA-9 TDK InvenSense; Value: *; MP: INMP441ACEZ-R7; Check_prices: https://www.snapeda.com/parts/INMP441ACEZ-R7/TDK/view-part/?ref=eda

## Sheet NanoD1_Wireless.SchDoc
size 420 x 297 mm; SheetNumber: 6; SheetTotal: 8
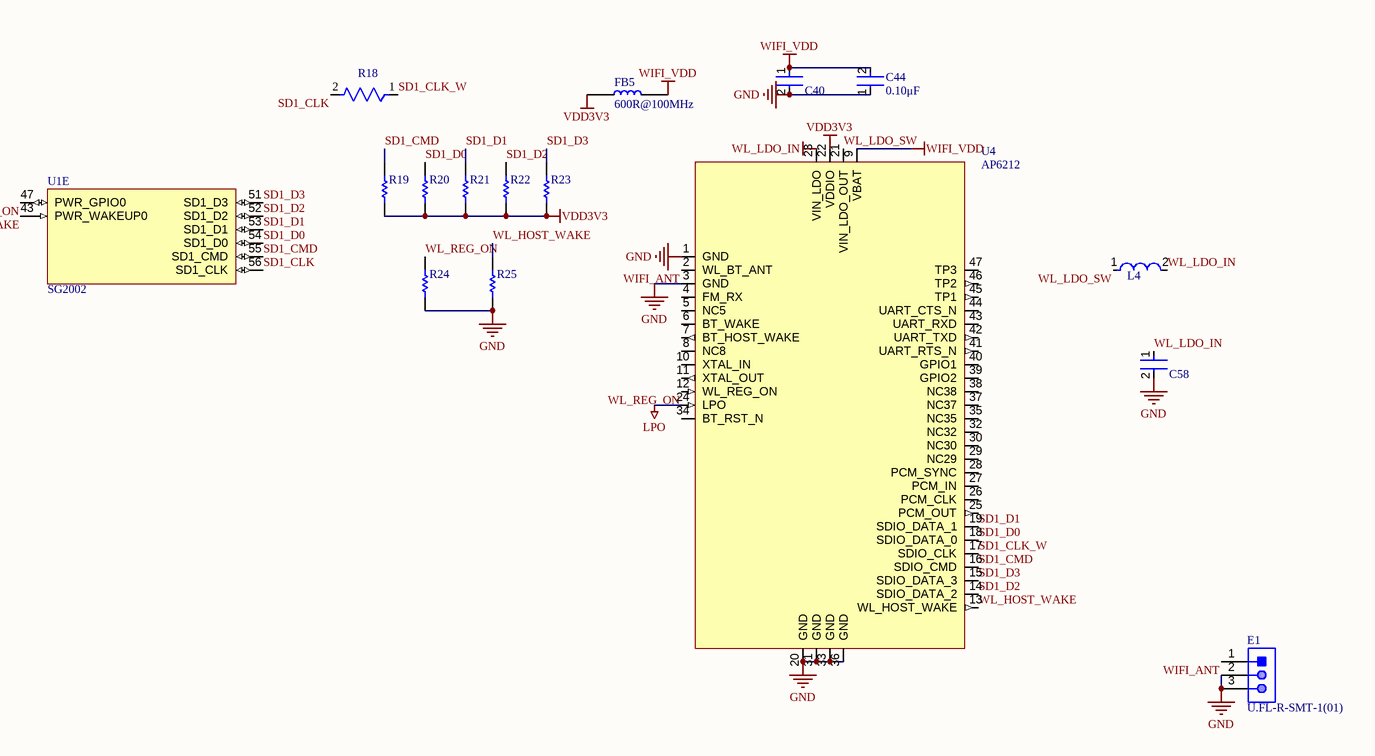
[diagram p5: NanoD1_Wireless.SchDoc]

### Parts
C40  10uF  [FP-GRM188-0_15-IPC_B]  (value not drawn)
C44  value 0.10μF  [FP-GRM15-MFG]  (hidden comment: 100nF)
C58  10uF  [FP-GRM188-0_15-IPC_B]  (value not drawn)
E1  U.FL-R-SMT-1(01)  [HRS-U.FL-R-SMT-3_V]
FB5  600R@100MHz  [INDC1608X95N]
L4  4.7uH  [FP-DFE252010C-MFG]  (value not drawn)
R18  22R  [FP-RC0402-0_4-IPC_A]  (value not drawn)
R19  10K  [RESC1005X40X25ML05T10]  (value not drawn)
R20  10K  [RESC1005X40X25ML05T10]  (value not drawn)
R21  10K  [RESC1005X40X25ML05T10]  (value not drawn)
R22  10K  [RESC1005X40X25ML05T10]  (value not drawn)
R23  10K  [RESC1005X40X25ML05T10]  (value not drawn)
R24  10K  [RESC1005X40X25ML05T10]  (value not drawn)
R25  10K  [RESC1005X40X25ML05T10]  (value not drawn)
U1  SG2002  [QFN88-9x9-0.35]  (part E of 7)
U4  AP6212  [AP6212-12x12]

### Nets
GND: C40.2 C44.1 C58.2 E1.2 E1.3 R24.1 R25.1 U4.1(GND) U4.3(GND) U4.20(GND) U4.31(GND) U4.33(GND) U4.36(GND)
LPO: U4.24(LPO)
VDD3V3: FB5.1 R19.1 R20.1 R21.1 R22.1 R23.1 U4.22(VDDIO)
WIFI_VDD: C40.1 C44.2 FB5.2 U4.9(VBAT)
WL_LDO_IN: C58.1 L4.2 U4.23(VIN_LDO)
SD1_CLK: R18.2 U1.56(SD1_CLK)
SD1_CLK_W: R18.1 U4.17(SDIO_CLK)
SD1_CMD: R19.2 U1.55(SD1_CMD) U4.16(SDIO_CMD)
SD1_D0: R20.2 U1.54(SD1_D0) U4.18(SDIO_DATA_0)
SD1_D1: R21.2 U1.53(SD1_D1) U4.19(SDIO_DATA_1)
SD1_D2: R22.2 U1.52(SD1_D2) U4.14(SDIO_DATA_2)
SD1_D3: R23.2 U1.51(SD1_D3) U4.15(SDIO_DATA_3)
WIFI_ANT: E1.1 U4.2(WL_BT_ANT)
WL_HOST_WAKE: R25.2 U1.43(PWR_WAKEUP0) U4.13(WL_HOST_WAKE)
WL_LDO_SW: L4.1 U4.21(VIN_LDO_OUT)
WL_REG_ON: R24.2 U1.47(PWR_GPIO0) U4.12(WL_REG_ON)

Not connected (* = marked no-connect by the designer): U4 4(FM_RX) 5(NC5) 6(BT_WAKE) 7(BT_HOST_WAKE) 8(NC8) 10(XTAL_IN) 11(XTAL_OUT) 25(PCM_OUT) 26(PCM_CLK) 27(PCM_IN) 28(PCM_SYNC) 29(NC29) 30(NC30) 32(NC32) 34(BT_RST_N) 35(NC35) 37(NC37) 38(NC38) 39(GPIO2) 40(GPIO1) 41(UART_RTS_N) 42(UART_TXD) 43(UART_RXD) 44(UART_CTS_N) 45(TP1) 46(TP2) 47(TP3)

### Notes on the sheet
- THIS DOCUMENT AND THE DATA DISCLOSED HEREIN OR
- HEREWITH IS THE PROPERTY OF ALTIUM LIMITED AND MAY
- DWG NO:
- REVISION
- REV:
- DESCRIPTION
- DATE
- APPROVED
- BE FREELY DISTRIBUTED IN WHOLE. NO RIGHTS ARE
- RESERVED OR EXPRESS OR IMPLIED WARANTEE GIVEN.
- ENG:
- APPROVALS
- PROJECT
- DSN:
- CHK:
- REFERENCE DOCUMENTS
- PROJECT REVISION:
- TITLE
- DOCUMENT REVISION:
- DESIGN ITEM:
- BOM:
- FAB DWG:
- PCB DWG:
- ASSY DWG:
- SCALE:
- A3
- SIZE
- CAGE CODE
- FILE NAME
- DWG NO.
- SHEET
- OF
- REV

### Library data of the parts
C40 C58 = CMP-06035-003612-1: as C21 on sheet NanoD1_Power; Tolerance: 20%; Dielectric: X5R; Package Quantity: 4000; Width: 0.8mm; Case/Package: 0603; Thickness: 0.035inch; Capacitance: 10uF; Voltage Rating: 10V; Voltage Rating (DC): 10V; Termination: SMD/SMT; Length: 1.6mm; Lead Free: Lead Free; Mount: Surface Mount; Height: 0.8mm; Depth: 0.8mm; Packaging: Tape and Reel; Weight: 0.000222oz; Min Operating Temperature: -55°C; Case Code (Metric): 1608; Max Operating Temperature: 85°C; Case Code (Imperial): 0603; Material: Ceramic
C44 = CMP-2100-03641-2: as C18 on sheet NanoD1_Power; RoHS: TRUE; Temperature Characteristic: X7R; Octopart: https://octopart.com/grm155r71c104ka88d-murata-196880; Digikey Description: CAP CER 0.1UF 16V X7R 0402; Device Class L3: Ceramic Capacitors; Height: 0.55mm; ComponentLink2Description: Datasheet; Temperature Range Low: -55°C; Ipc Land Pattern Name: CAPC10050X219; ComponentLink2URL: https://search.murata.co.jp/Ceramy/image/img/A01X/G101/ENG/GRM155R71H471KA01-01A.pdf; Device Class L1: Passive Components; Lead Free: yes; Category: Cap; Package: GRM15; Temperature: -55°C to +125°C; Device Class L2: Capacitors; Capacitance: 0.10μF; Temperature Range High: +125°C; Mouser Description: 0402 0.1 uF 16V ±10 % Tolerance X7R SMT Multilayer Ceramic Capacitor
E1 = CMP-2000-05153-1: Ultra Small Coaxial Connector, 6 GHz, -40 to 90 degC, 3-Pin SMD, RoHS, Bulk; Manufacturer: Hirose Electric; Connector Style: U.FL; Impedance: 50Ohm; Dielectric Material: LiquidCrystalPolymer(LCP); Minimum Quantity: UltraMiniatureCoaxial; Online Catalog: U.FLSeries; Featured Product: HiroseU.FLSeries; Frequency - Max: 6GHz; Other Names: H122041 / U.FL-R-SMT-1(01)-ND; Contact Termination: Solder; Body Material: PhosphorBronze; Connector Type: Jack,MalePin; Body Finish: Silver; Center Contact Plating: Gold; Manufacturer URL: https://www.hirose.com; Family: CoaxialConnectors(RF); Fastening Type: Snap-On; Unit PriceUSD: U.FL; Series: U.FL; Package Reference: U.FL-R-SMT; Packaging: Bulk; Standard Package: 100; Mounting Type: SurfaceMount; Quantity Available: Bulk; Housing Color: Silver; Package Description: 3-Pin Surface Mount Device, Body 2.6 x 2.6 mm; Category: Connectors,Interconnects; Operating Temperature: -40degC~90degC; Center Contact Material: PhosphorBronze; Dynamic Catalog: U.FLSeries; Datasheet URL: https://datasheet.ciiva.com/26945/getdatasheetpartid-475239-26945414.pdf; Datasheet Version: Feb-09; Shield Termination: Solder
FB5 = MPZ1608S601ATA00: as FB2 on sheet NanoD1_Power; SnapEDA_Link: https://www.snapeda.com/parts/MPZ1608S601ATA00/TDK/view-part/?ref=snap; Package: 0603 TDK; Value: 600R@100MHz; MP: MPZ1608S601ATA00; Check_prices: https://www.snapeda.com/parts/MPZ1608S601ATA00/TDK/view-part/?ref=eda
L4 = CMP-06042-014898-1: Shielded Wirewound Inductor 4.7uH  1100mA 0.27Ω 1008 (2520); Core Material: Ferrite; Test Frequency: 1MHz; Current Rating: 1.7A; Max DC Current: 1.1A; DC Resistance (DCR): 270mR; Tolerance: 20%; Max Operating Temperature: 125°C; Length: 0.098inch; Inductance: 4.7uH; Height - Seated (Max): 0.039inch; Min Operating Temperature: -40°C; Case Code (Imperial): 1008; Mount: Surface Mount; Resistor Type: Wirewound; Shielding: Shielded; Case Code (Metric): 2520; Case/Package: 1008; Width: 0.079inch; Depth: 2mm; Packaging: Tape and Reel
R18 = CMP-2002-07520-2: as R1 on sheet NanoD1_Storage; Termination: SMD/SMT; Depth: 500µm; Packaging: Tape & Reel; Height: 400µm; Width: 500µm; Case Code (Imperial): 0402; Length: 1mm; Schedule B: 8533210045, 8533210045|8533210045|8533210045|8533210045|8533210045|8533210045|8533210045|8533210045, 8533210045|8533210045|8533210045|8533210045|8533210045|8533210045|8533210045|8533210045|8533210045, 8533210045|8533210045|8533210045|8533210045|8533210045|8533210045|8533210045|8533210045|8533210045|8533210045; Case/Package: 0402; Max Operating Temperature: 155°C; Min Operating Temperature: -55°C; REACH SVHC: Unknown; RoHS: Compliant; Military Standard: Not; Voltage Rating (DC): 50V; Lead Free: Lead Free; Voltage Rating (AC): 50V; Number of Pins: 2; Composition: Thick Film
R19-R25 = CMP-2002-07353-1: as R17 on sheet NanoD1_Power
U1 = SG2002: as U1 on sheet NanoD1_Power

## Sheet NanoD1_Clk_Reset.SchDoc
size 420 x 297 mm; SheetNumber: 7; SheetTotal: 8
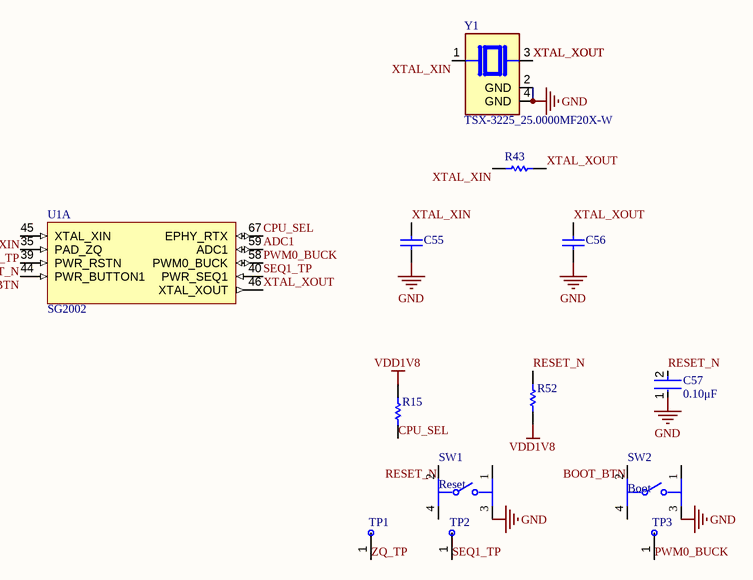
[diagram p6: NanoD1_Clk_Reset.SchDoc]

### Parts
C55  18pF  [CAPC1005X55X25LL05T10]  (value not drawn)
C56  18pF  [CAPC1005X55X25LL05T10]  (value not drawn)
C57  value 0.10μF  [FP-GRM15-MFG]  (hidden comment: 100nF)
R15  4.7K  [RESC1005X40X25ML05T10]  (value not drawn)
R43  1M  [RESC1005X40X25ML05T10]  (value not drawn)
R52  10K  [RESC1005X40X25ML05T10]  (value not drawn)
SW1  Reset  [FP-EVQ-P2002M-MFG]
SW2  Boot  [FP-EVQ-P2002M-MFG]
TP1  TP  [TP-1.5mm]  (value not drawn)
TP2  TP  [TP-1.5mm]  (value not drawn)
TP3  TP  [TP-1.5mm]  (value not drawn)
U1  SG2002  [QFN88-9x9-0.35]  (part A of 7)
Y1  TSX-3225_25.0000MF20X-W  [XTAL_TSX-3225_25.0000MF20X-W]

### Nets
GND: C55.1 C56.1 C57.1 SW1.3 SW2.3 Y1.2(GND) Y1.4(GND)
VDD1V8: R15.2 R52.1
ADC1: U1.59(ADC1)
BOOT_BTN: SW2.2 U1.44(PWR_BUTTON1)
CPU_SEL: R15.1 U1.67(EPHY_RTX)
PWM0_BUCK: TP3.1(TP) U1.58(PWM0_BUCK)
RESET_N: C57.2 R52.2 SW1.2 U1.39(PWR_RSTN)
SEQ1_TP: TP2.1(TP) U1.40(PWR_SEQ1)
XTAL_XIN: C55.2 R43.2 U1.45(XTAL_XIN) Y1.1
XTAL_XOUT: C56.2 R43.1 U1.46(XTAL_XOUT) Y1.3
ZQ_TP: TP1.1(TP) U1.35(PAD_ZQ)

Not connected (* = marked no-connect by the designer): SW1 1 4; SW2 1 4

### Notes on the sheet
- Type @ to refer to a designator
- (near R43) Type @ to refer to a designator
- THIS DOCUMENT AND THE DATA DISCLOSED HEREIN OR
- HEREWITH IS THE PROPERTY OF ALTIUM LIMITED AND MAY
- DWG NO:
- REVISION
- REV:
- DESCRIPTION
- DATE
- APPROVED
- BE FREELY DISTRIBUTED IN WHOLE. NO RIGHTS ARE
- RESERVED OR EXPRESS OR IMPLIED WARANTEE GIVEN.
- ENG:
- APPROVALS
- PROJECT
- DSN:
- CHK:
- REFERENCE DOCUMENTS
- PROJECT REVISION:
- TITLE
- DOCUMENT REVISION:
- DESIGN ITEM:
- BOM:
- FAB DWG:
- PCB DWG:
- ASSY DWG:
- SCALE:
- A3
- SIZE
- CAGE CODE
- FILE NAME
- DWG NO.
- SHEET
- OF
- REV

### Library data of the parts
C55 C56 = CMP-2008-03918-1: Part Number: GRM1555C1H180JA01D; Manufacturer: Murata
C57 = CMP-2100-03641-2: as C18 on sheet NanoD1_Power; RoHS: TRUE; Temperature Characteristic: X7R; Octopart: https://octopart.com/grm155r71c104ka88d-murata-196880; Digikey Description: CAP CER 0.1UF 16V X7R 0402; Device Class L3: Ceramic Capacitors; Height: 0.55mm; ComponentLink2Description: Datasheet; Temperature Range Low: -55°C; Ipc Land Pattern Name: CAPC10050X219; ComponentLink2URL: https://search.murata.co.jp/Ceramy/image/img/A01X/G101/ENG/GRM155R71H471KA01-01A.pdf; Device Class L1: Passive Components; Lead Free: yes; Category: Cap; Package: GRM15; Temperature: -55°C to +125°C; Device Class L2: Capacitors; Capacitance: 0.10μF; Temperature Range High: +125°C; Mouser Description: 0402 0.1 uF 16V ±10 % Tolerance X7R SMT Multilayer Ceramic Capacitor
R15 = CMP-1011-00586-2: as R9 on sheet NanoD1_Storage
R43 = CMP-2002-07490-1: Manufacturer: Yageo / Phycomp; Part Number: RC0402FR-071ML
R52 = CMP-2002-07353-1: as R17 on sheet NanoD1_Power
SW1 SW2 = CMP-00287-40010164-1: EVQ-P2002M Switch Tactile N.O. SPST Button J-Bend 0.02A 15VDC 1N SMD Automotive Embossed T/R; Mechanical Life: 1Mcycles; Voltage Rating (DC): 15V; Contact Resistance: 100mΩ; Illumination Type: Illuminated, Non-Illuminated; Actuator Length: 450µm; Number of Positions: 2; Current Rating: 20mA; Switch Function: Off-Mom; Switch Travel: 250µm; Electrical Life: 1Mcycles; Lead Free: Lead Free; Mount: Surface Mount; Max Voltage Rating (DC): 15V; Termination: J-Bend; Max Operating Temperature: 85°C; Throw Configuration: SPST; Height: 2.3mm; Contact Current Rating: 20mA; Radiation Hardening: No; Min Operating Temperature: -40°C; NexarPartId: 40010164; Orientation: Straight; RoHS: Compliant; Operating Force: 1N; Life (Cycles): 1Mcycles; REACH SVHC: No SVHC
TP1-TP3 = TestPoint: Test point, 1.5 mm exposed pad
U1 = SG2002: as U1 on sheet NanoD1_Power
Y1 = TSX-3225_25.0000MF20X-W: MF: {'manufacturer': u'Epson Timing'}; MP: TSX-3225 25.0000MF20X-W; Package: None; Price: None; Value: *; Availability: Unavailable

## Sheet NanoD1_IO.SchDoc
size 420 x 297 mm; SheetNumber: 8; SheetTotal: 8; SPICEModelCacheMQURISAM: <root> / <DocumentId>MQURISAM</DocumentId> / </root>
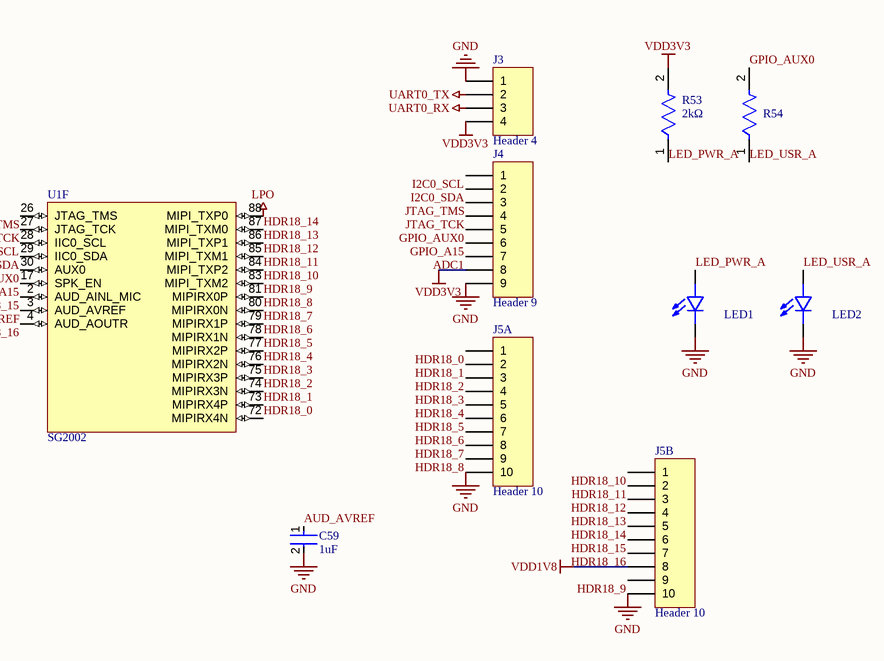
[diagram p7: NanoD1_IO.SchDoc]

### Parts
C59  1uF  [FP-GRM15-0_1-IPC_B]
J3  Header 4  [HDR1X4]
J4  Header 9  [HDR1X9]
J5A  Header 10  [HDR1X10]
J5B  Header 10  [HDR1X10]
LED1  KP-1608SGC  [LED_KP-1608SGC]  (value not drawn)
LED2  KP-1608SGC  [LED_KP-1608SGC]  (value not drawn)
R53  value 2kΩ  [FP-RC_L0402-IPC_A]  (hidden comment: 2K)
R54  1K  [FP-RC0402-0_4-MFG]  (value not drawn)
U1  SG2002  [QFN88-9x9-0.35]  (part F of 7)

### Nets
GND: C59.2 J3.1 J4.9 J5A.10 J5B.10 LED1.C LED2.C
LPO: U1.88(MIPI_TXP0)
UART0_RX: J3.3
UART0_TX: J3.2
VDD1V8: J5B.8
VDD3V3: J3.4 J4.8 R53.2
ADC1: J4.7
AUD_AVREF: C59.1 U1.3(AUD_AVREF)
GPIO_A15: J4.6 U1.17(SPK_EN)
GPIO_AUX0: J4.5 R54.2 U1.30(AUX0)
HDR18_0: J5A.1 U1.72(MIPIRX4N)
HDR18_1: J5A.2 U1.73(MIPIRX4P)
HDR18_2: J5A.3 U1.74(MIPIRX3N)
HDR18_3: J5A.4 U1.75(MIPIRX3P)
HDR18_4: J5A.5 U1.76(MIPIRX2N)
HDR18_5: J5A.6 U1.77(MIPIRX2P)
HDR18_6: J5A.7 U1.78(MIPIRX1N)
HDR18_7: J5A.8 U1.79(MIPIRX1P)
HDR18_8: J5A.9 U1.80(MIPIRX0N)
HDR18_9: J5B.9 U1.81(MIPIRX0P)
HDR18_10: J5B.1 U1.83(MIPI_TXM2)
HDR18_11: J5B.2 U1.84(MIPI_TXP2)
HDR18_12: J5B.3 U1.85(MIPI_TXM1)
HDR18_13: J5B.4 U1.86(MIPI_TXP1)
HDR18_14: J5B.5 U1.87(MIPI_TXM0)
HDR18_15: J5B.6 U1.2(AUD_AINL_MIC)
HDR18_16: J5B.7 U1.4(AUD_AOUTR)
I2C0_SCL: J4.1 U1.28(IIC0_SCL)
I2C0_SDA: J4.2 U1.29(IIC0_SDA)
JTAG_TCK: J4.4 U1.27(JTAG_TCK)
JTAG_TMS: J4.3 U1.26(JTAG_TMS)
LED_PWR_A: LED1.A R53.1
LED_USR_A: LED2.A R54.1

### Notes on the sheet
- THIS DOCUMENT AND THE DATA DISCLOSED HEREIN OR
- HEREWITH IS THE PROPERTY OF ALTIUM LIMITED AND MAY
- DWG NO:
- REVISION
- REV:
- DESCRIPTION
- DATE
- APPROVED
- BE FREELY DISTRIBUTED IN WHOLE. NO RIGHTS ARE
- RESERVED OR EXPRESS OR IMPLIED WARANTEE GIVEN.
- ENG:
- APPROVALS
- PROJECT
- DSN:
- CHK:
- REFERENCE DOCUMENTS
- PROJECT REVISION:
- TITLE
- DOCUMENT REVISION:
- DESIGN ITEM:
- BOM:
- FAB DWG:
- PCB DWG:
- ASSY DWG:
- SCALE:
- A3
- SIZE
- CAGE CODE
- FILE NAME
- DWG NO.
- SHEET
- OF
- REV

### Library data of the parts
C59 = CMP-2008-04556-2: as C17 on sheet NanoD1_Power; Value: 1uF; Octopart: https://octopart.com/grm155r61a105ke15d-murata-197442; Lead Free: Yes; ComponentLink2Description: Datasheet; Temperature: -55°C to +85°C; Temperature Range High: +85°C; Height: 0.55mm; Capacitance: 1uF; Ipc Land Pattern Name: CAPC10050X50; ComponentLink2URL: https://search.murata.co.jp/Ceramy/image/img/A01X/G101/ENG/GRM155R61A105KE15-01A.pdf; Temperature Range Low: -55°C; Device Class L2: Capacitors; Voltage Rating: 10V; RoHS: TRUE; Device Class L1: Passive Components; Device Class L3: Ceramic Capacitors; Temperature Characteristic: X5R; Mouser Description: 0402 1 uF 10 V ±10% Tolerance X5R Surface Mount Multilayer Ceramic Capacitor; Automotive: No; Package: GRM15-0.1; Digikey Description: CAP CER 1UF 10V X5R 0402; Category: Cap
J3 = Header 4: Header, 4-Pin; LatestRevisionDate: 17-Jul-2002; LatestRevisionNote: Re-released for DXP Platform.; Publisher: Altium Limited
J4 = Header 9: Header, 9-Pin; LatestRevisionDate: 17-Jul-2002; LatestRevisionNote: Re-released for DXP Platform.; Publisher: Altium Limited
J5A J5B = Header 10: Header, 10-Pin; LatestRevisionDate: 17-Jul-2002; LatestRevisionNote: Re-released for DXP Platform.; Publisher: Altium Limited
LED1 LED2 = KP-1608SGC: KP-1608SGC Green LED, 568 nm 1608 (0603), Rectangle Lens SMD package; MF: Kingbright; SnapEDA_Link: https://www.snapeda.com/parts/KP-1608SGC/Kingbright/view-part/?ref=snap; Package: 0603 Kingbright; Value: *; MP: KP-1608SGC; Check_prices: https://www.snapeda.com/parts/KP-1608SGC/Kingbright/view-part/?ref=eda
R53 = CMP-2002-07580-2: RES SMD 2K OHM 1% 1/16W 0402; Manufacturer: Yageo; Manufacturer Part Number: RC0402FR-072KL; Voltage Rating: 50V; Temperature Coefficient: 100ppm/°C; Power Rating: 0.0625W; Standoff Height: 0mm; Category: Res; Device Class L3: Chip SMD Resistors; Octopart: https://octopart.com/rc0402fr-072kl-yageo-5032519; Mouser Description: RES SMD 2K OHM 1% 1/16W 0402; RoHS: TRUE; Temperature: -55°C to +155°C; Device Class L2: Resistors; Series: RC_L; Automotive: No; Resistance: 2kΩ; Temperature Range Low: -55°C; Footprint Url: https://www.yageo.com/upload/website/yageo_PYu-R_Mount_10_19050818_343.pdf; Height: 0.4mm; ComponentLink2Description: Datasheet; Package: RC_L0402; ComponentLink2URL: http://www.yageo.com/documents/recent/PYu-RC_Group_51_RoHS_L_9.pdf; Temperature Range High: +155°C; Lead Free: Yes; Device Class L1: Passive Components; Ipc Land Pattern Name: RESC10050X35; Composition: Thick Film; Digikey Description: RES SMD 2K OHM 1% 1/16W 0402; Tolerance: 1%
R54 = CMP-2002-07472-3: RES 1K OHM 1% 1/16W 0402; Max Power Dissipation: 63mW; Resistance: 1kR; Voltage Rating (DC): 50V; Temperature Coefficient: 100ppm/°C; Power Rating: 62.5mW; Technology: THICK FILM; Size Code: 0402; Series: RC; Length: 1mm; Case/Package: 0402; Features: Moisture Resistant; Termination: SMD/SMT; Case Code (Metric): 1005; Reach SVHC Compliant: Yes; Number of Terminations: 2; Tolerance: 1%; Lead Free: Lead Free; Military Standard: Not; Resistor Type: Thick Film; Max Operating Temperature: 155°C; RoHS Compliant: Yes; Construction: Rectangular; Voltage Rating: 50V; Packaging: Tape and Reel; Height: 0.32mm; Number of Pins: 2; Resistance Tolerance: 1%; Case Code (Imperial): 0402; Depth: 0.5mm; Min Operating Temperature: -55°C; Width: 0.5mm
U1 = SG2002: as U1 on sheet NanoD1_Power